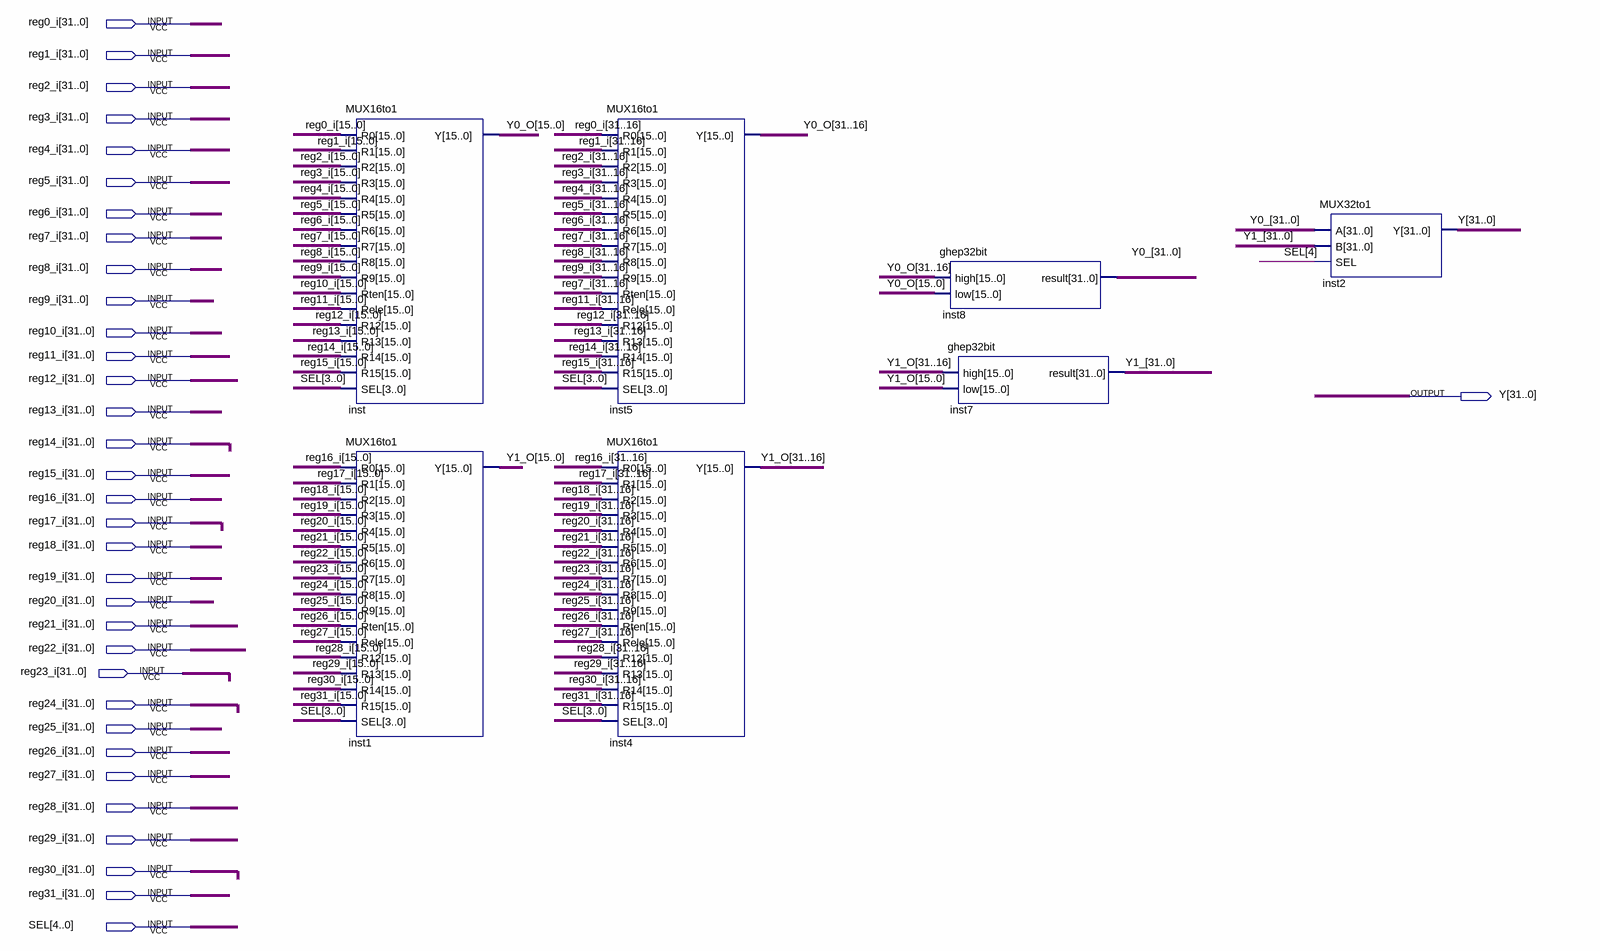
[diagram p0: schematic sheet]
// Quartus schematic MUX32TO1-32BIT.bdf as structural Verilog: 7 symbols, 34 pins
module \MUX32TO1-32BIT  (
  input  [31:0] reg0_i,
  input  [31:0] reg1_i,
  input  [31:0] reg2_i,
  input  [31:0] reg3_i,
  input  [31:0] reg4_i,
  input  [31:0] reg5_i,
  input  [31:0] reg6_i,
  input  [31:0] reg7_i,
  input  [31:0] reg8_i,
  input  [31:0] reg9_i,
  input  [31:0] reg10_i,
  input  [31:0] reg11_i,
  input  [31:0] reg12_i,
  input  [31:0] reg13_i,
  input  [31:0] reg14_i,
  input  [31:0] reg15_i,
  input  [31:0] reg16_i,
  input  [31:0] reg17_i,
  input  [31:0] reg18_i,
  input  [31:0] reg19_i,
  input  [31:0] reg20_i,
  input  [31:0] reg21_i,
  input  [31:0] reg22_i,
  input  [31:0] reg23_i,
  input  [31:0] reg24_i,
  input  [31:0] reg25_i,
  input  [31:0] reg26_i,
  input  [31:0] reg27_i,
  input  [31:0] reg28_i,
  input  [31:0] reg29_i,
  input  [31:0] reg30_i,
  input  [31:0] reg31_i,
  input  [4:0] SEL,
  output [31:0] Y
);

  wire [31:0] Y0_, Y0_O, Y1_, Y1_O;

  MUX16to1 inst (
    .R0(reg0_i[15:0]), .R1(reg1_i[15:0]), .R2(reg2_i[15:0]), .R3(reg3_i[15:0]), .R4(reg4_i[15:0]),
    .R5(reg5_i[15:0]), .R6(reg6_i[15:0]), .R7(reg7_i[15:0]), .R8(reg8_i[15:0]), .R9(reg9_i[15:0]),
    .Rten(reg10_i[15:0]), .Rele(reg11_i[15:0]), .R12(reg12_i[15:0]), .R13(reg13_i[15:0]),
    .R14(reg14_i[15:0]), .R15(reg15_i[15:0]), .SEL(SEL[3:0]), .Y(Y0_O[15:0]));
  MUX16to1 inst1 (
    .R0(reg16_i[15:0]), .R1(reg17_i[15:0]), .R2(reg18_i[15:0]), .R3(reg19_i[15:0]), .R4(reg20_i[15:0]),
    .R5(reg21_i[15:0]), .R6(reg22_i[15:0]), .R7(reg23_i[15:0]), .R8(reg24_i[15:0]), .R9(reg25_i[15:0]),
    .Rten(reg26_i[15:0]), .Rele(reg27_i[15:0]), .R12(reg28_i[15:0]), .R13(reg29_i[15:0]),
    .R14(reg30_i[15:0]), .R15(reg31_i[15:0]), .SEL(SEL[3:0]), .Y(Y1_O[15:0]));
  MUX16to1 inst5 (
    .R0(reg0_i[31:16]), .R1(reg1_i[31:16]), .R2(reg2_i[31:16]), .R3(reg3_i[31:16]), .R4(reg4_i[31:16]),
    .R5(reg5_i[31:16]), .R6(reg6_i[31:16]), .R7(reg7_i[31:16]), .R8(reg8_i[31:16]), .R9(reg9_i[31:16]),
    .Rten(reg7_i[31:16]), .Rele(reg11_i[31:16]), .R12(reg12_i[31:16]), .R13(reg13_i[31:16]),
    .R14(reg14_i[31:16]), .R15(reg15_i[31:16]), .SEL(SEL[3:0]), .Y(Y0_O[31:16]));
  MUX16to1 inst4 (
    .R0(reg16_i[31:16]), .R1(reg17_i[31:16]), .R2(reg18_i[31:16]), .R3(reg19_i[31:16]), .R4(reg20_i[31:16]),
    .R5(reg21_i[31:16]), .R6(reg22_i[31:16]), .R7(reg23_i[31:16]), .R8(reg24_i[31:16]), .R9(reg25_i[31:16]),
    .Rten(reg26_i[31:16]), .Rele(reg27_i[31:16]), .R12(reg28_i[31:16]), .R13(reg29_i[31:16]),
    .R14(reg30_i[31:16]), .R15(reg31_i[31:16]), .SEL(SEL[3:0]), .Y(Y1_O[31:16]));
  ghep32bit inst8 (.high(Y0_O[31:16]), .low(Y0_O[15:0]), .result(Y0_));
  ghep32bit inst7 (.high(Y1_O[31:16]), .low(Y1_O[15:0]), .result(Y1_));
  MUX32to1 inst2 (.A(Y0_), .B(Y1_), .SEL(SEL[4]), .Y(Y));
endmodule
